# Altium schematic sheet Top-Sheet.SchDoc
size 420 x 297 mm; SheetNumber: 1; SheetTotal: 5
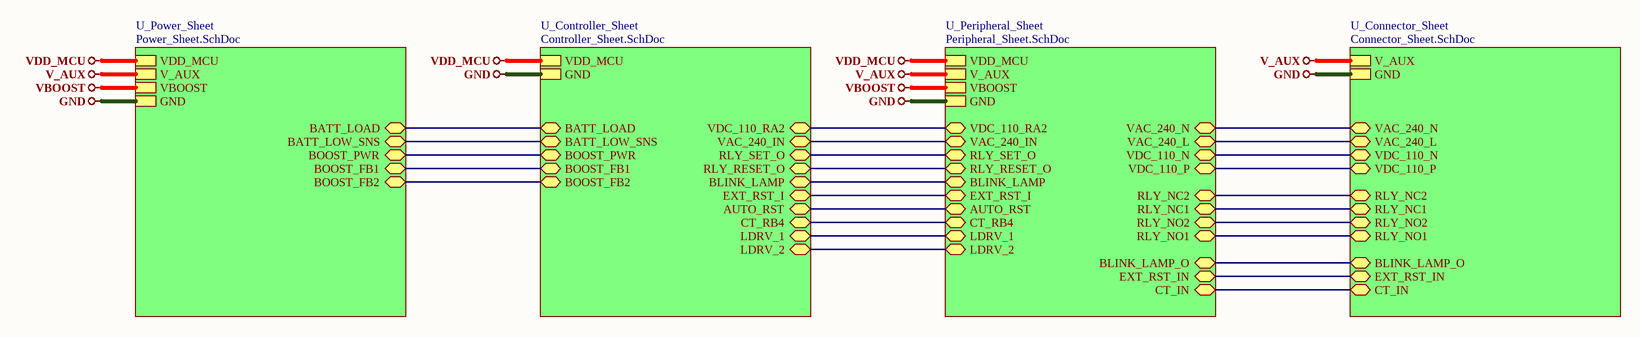
[diagram p0: Top-Sheet.SchDoc]

## Sub-sheets
U_Connector_Sheet = Connector_Sheet.SchDoc: VAC_240_N (bidir), VAC_240_L (bidir), V_AUX, GND, VDC_110_N (bidir), VDC_110_P (bidir), RLY_NC2 (bidir), RLY_NC1 (bidir), RLY_NO2 (bidir), RLY_NO1 (bidir), BLINK_LAMP_O (bidir), EXT_RST_IN (bidir), CT_IN (bidir)
U_Controller_Sheet = Controller_Sheet.SchDoc: VDC_110_RA2 (bidir), VAC_240_IN (bidir), RLY_SET_O (bidir), RLY_RESET_O (bidir), VDD_MCU, GND, BLINK_LAMP (bidir), EXT_RST_I (bidir), AUTO_RST (bidir), CT_RB4 (bidir), LDRV_1 (bidir), LDRV_2 (bidir), BATT_LOAD (bidir), BATT_LOW_SNS (bidir), BOOST_PWR (bidir), BOOST_FB1 (bidir), BOOST_FB2 (bidir)
U_Peripheral_Sheet = Peripheral_Sheet.SchDoc: VDD_MCU, V_AUX, VBOOST, GND, VDC_110_RA2 (bidir), VAC_240_IN (bidir), RLY_SET_O (bidir), RLY_RESET_O (bidir), BLINK_LAMP (bidir), EXT_RST_I (bidir), AUTO_RST (bidir), CT_RB4 (bidir), LDRV_1 (bidir), LDRV_2 (bidir), VAC_240_N (bidir), VAC_240_L (bidir), VDC_110_N (bidir), VDC_110_P (bidir), RLY_NC2 (bidir), RLY_NC1 (bidir), RLY_NO2 (bidir), RLY_NO1 (bidir), BLINK_LAMP_O (bidir), EXT_RST_IN (bidir), CT_IN (bidir)
U_Power_Sheet = Power_Sheet.SchDoc: VDD_MCU, V_AUX, VBOOST, GND, BATT_LOAD (bidir), BATT_LOW_SNS (bidir), BOOST_PWR (bidir), BOOST_FB1 (bidir), BOOST_FB2 (bidir)

## Nets
GND: sheet U_Controller_Sheet/GND, sheet U_Power_Sheet/GND, sheet U_Connector_Sheet/GND, sheet U_Peripheral_Sheet/GND
V_AUX: sheet U_Power_Sheet/V_AUX, sheet U_Connector_Sheet/V_AUX, sheet U_Peripheral_Sheet/V_AUX
VBOOST: sheet U_Power_Sheet/VBOOST, sheet U_Peripheral_Sheet/VBOOST
VDD_MCU: sheet U_Controller_Sheet/VDD_MCU, sheet U_Power_Sheet/VDD_MCU, sheet U_Peripheral_Sheet/VDD_MCU
(unnamed): sheet U_Controller_Sheet/VDC_110_RA2, sheet U_Peripheral_Sheet/VDC_110_RA2
(unnamed): sheet U_Controller_Sheet/VAC_240_IN, sheet U_Peripheral_Sheet/VAC_240_IN
(unnamed): sheet U_Controller_Sheet/RLY_SET_O, sheet U_Peripheral_Sheet/RLY_SET_O
(unnamed): sheet U_Controller_Sheet/RLY_RESET_O, sheet U_Peripheral_Sheet/RLY_RESET_O
(unnamed): sheet U_Controller_Sheet/BLINK_LAMP, sheet U_Peripheral_Sheet/BLINK_LAMP
(unnamed): sheet U_Controller_Sheet/EXT_RST_I, sheet U_Peripheral_Sheet/EXT_RST_I
(unnamed): sheet U_Controller_Sheet/AUTO_RST, sheet U_Peripheral_Sheet/AUTO_RST
(unnamed): sheet U_Controller_Sheet/CT_RB4, sheet U_Peripheral_Sheet/CT_RB4
(unnamed): sheet U_Controller_Sheet/LDRV_1, sheet U_Peripheral_Sheet/LDRV_1
(unnamed): sheet U_Controller_Sheet/LDRV_2, sheet U_Peripheral_Sheet/LDRV_2
(unnamed): sheet U_Controller_Sheet/BATT_LOAD, sheet U_Power_Sheet/BATT_LOAD
(unnamed): sheet U_Controller_Sheet/BATT_LOW_SNS, sheet U_Power_Sheet/BATT_LOW_SNS
(unnamed): sheet U_Controller_Sheet/BOOST_PWR, sheet U_Power_Sheet/BOOST_PWR
(unnamed): sheet U_Controller_Sheet/BOOST_FB1, sheet U_Power_Sheet/BOOST_FB1
(unnamed): sheet U_Controller_Sheet/BOOST_FB2, sheet U_Power_Sheet/BOOST_FB2
(unnamed): sheet U_Connector_Sheet/VAC_240_N, sheet U_Peripheral_Sheet/VAC_240_N
(unnamed): sheet U_Connector_Sheet/VAC_240_L, sheet U_Peripheral_Sheet/VAC_240_L
(unnamed): sheet U_Connector_Sheet/VDC_110_N, sheet U_Peripheral_Sheet/VDC_110_N
(unnamed): sheet U_Connector_Sheet/VDC_110_P, sheet U_Peripheral_Sheet/VDC_110_P
(unnamed): sheet U_Connector_Sheet/RLY_NC2, sheet U_Peripheral_Sheet/RLY_NC2
(unnamed): sheet U_Connector_Sheet/RLY_NC1, sheet U_Peripheral_Sheet/RLY_NC1
(unnamed): sheet U_Connector_Sheet/RLY_NO2, sheet U_Peripheral_Sheet/RLY_NO2
(unnamed): sheet U_Connector_Sheet/RLY_NO1, sheet U_Peripheral_Sheet/RLY_NO1
(unnamed): sheet U_Connector_Sheet/BLINK_LAMP_O, sheet U_Peripheral_Sheet/BLINK_LAMP_O
(unnamed): sheet U_Connector_Sheet/EXT_RST_IN, sheet U_Peripheral_Sheet/EXT_RST_IN
(unnamed): sheet U_Connector_Sheet/CT_IN, sheet U_Peripheral_Sheet/CT_IN

## Notes on the sheet
- Reflect Ein Technology Labs Sdn Bhd
- File:
- Title:
- Date:
- Page
- Num:
- Total:
- Drawn By: Nabil bin Feisal Bamadhaj